# Altium schematic sheet KIT_ARDUINO_PER_R00.SchDoc: KIT ARDUINO 2022
size A4; Author: Valeria Bank; CompanyName: Sistemas De Representacion; Revision: R00; SheetNumber: 3; SheetTotal: 4; SPICEModelCacheQUHMHHDS: <root> / <DocumentId>QUHMHHDS</DocumentId> / <CacheFrame Number="0"> / <Model Name="res" Kind="MDL"> / <Text>*Default semiconductor resistor / .MODEL RES R()</Text> / </Model> / <Model Name="led0" Kind="MDL"> / <Text>*Typ INFRARED GaAs LED: Vf=1.2V Vr=5V If=40mA trr=3uS / *LED Pinout: 1=A, 2=K / .MODEL LED0 D (IS=93.5P RS=84M N=2.63 BV=5 IBV=10U / + CJO=2.97P VJ=.75 M=.333 TT=4.32U)</Text> / </Model> / <Model Name="npn" Kind="MDL"> / <Text>*Default NPN BJT / *NPN Trans Pinout: C,B,E / .MODEL NPN NPN()</Text> / </Model> / <Model Name="diode" Kind="MDL"> / <Text>*Default Diode / *Diode Pinout: A,K / .MODEL DIODE D()</Text> / </Model> / </CacheFrame> / </root>
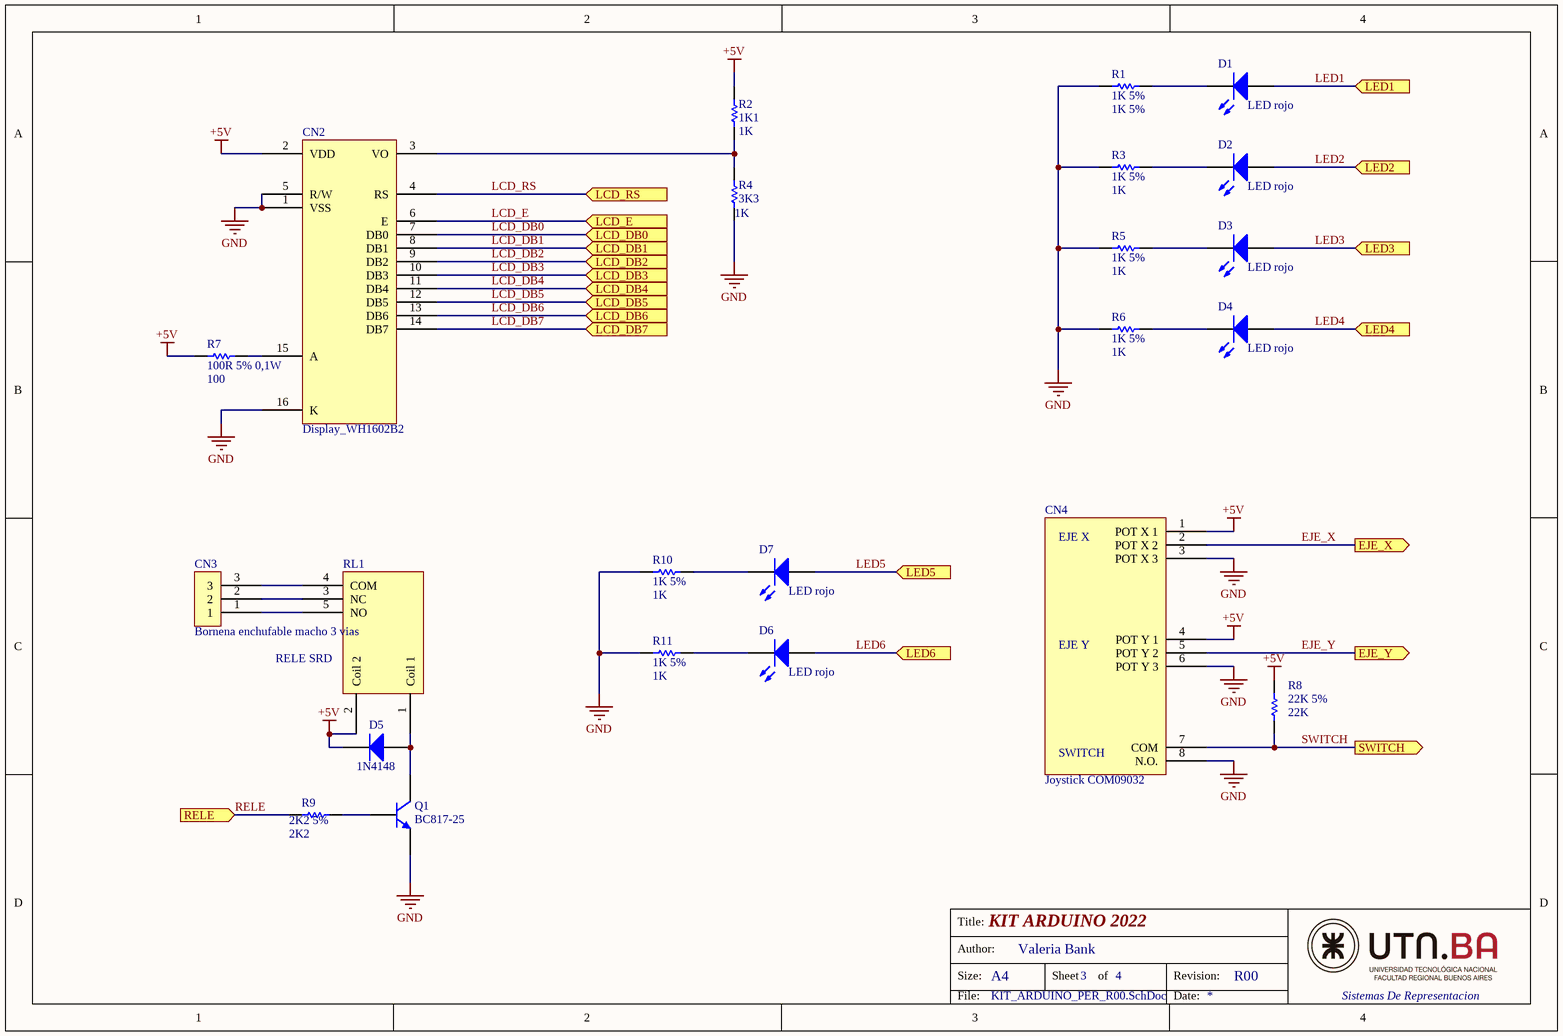
[diagram p0: KIT_ARDUINO_PER_R00.SchDoc]

## Parts
CN2  Display_WH1602B2  [WH1602B]
CN3  Bornena enchufable macho 3 vias  [BORNERA-3 VIAS]
CN4  Joystick COM09032  [Joystick 4398]
D1  LED rojo  [LED 5MM]
D2  LED rojo  [LED 5MM]
D3  LED rojo  [LED 5MM]
D4  LED rojo  [LED 5MM]
D5  1N4148  [SOD_323]
D6  LED rojo  [LED 5MM]
D7  LED rojo  [LED 5MM]
Q1  BC817-25  [SOT_23]
R1  1K 5%  [R_0805]
R2  1K1  value 1K  [R_0805]
R3  1K 5%  value 1K  [R_0805]
R4  3K3  value 1K  [R_0805]
R5  1K 5%  value 1K  [R_0805]
R6  1K 5%  value 1K  [R_0805]
R7  100R 5% 0,1W  value 100  [R_0805]
R8  22K 5%  value 22K  [R_0805]
R9  2K2 5%  value 2K2  [R_0805]
R10  1K 5%  value 1K  [R_0805]
R11  1K 5%  value 1K  [R_0805]
RL1  RELE SRD  [Relay]

## Ports
EJE_X (out), EJE_Y (out), LCD_DB0 (in), LCD_DB1 (in), LCD_DB2 (in), LCD_DB3 (in), LCD_DB4 (in), LCD_DB5 (in), LCD_DB6 (in), LCD_DB7 (in), LCD_E (in), LCD_RS (in), LED1 (in), LED2 (in), LED3 (in), LED4 (in), LED5 (in), LED6 (in), RELE (in), SWITCH (out)

## Nets
+5V: CN2.2(VDD) CN4.1(POT_X_1) CN4.4(POT_Y_1) D5.2(K) R2.2 R7.1 R8.2 RL1.2(Coil_2)
GND: CN2.1(VSS) CN2.5(R/W) CN2.16(K) CN4.3(POT_X_3) CN4.6(POT_Y_3) CN4.8(N.O.) Q1.3(E) R1.1 R3.1 R4.1 R5.1 R6.1 R10.1 R11.1
EJE_X: CN4.2(POT_X_2) ; port EJE_X
EJE_Y: CN4.5(POT_Y_2) ; port EJE_Y
LCD_DB0: CN2.7(DB0) ; port LCD_DB0
LCD_DB1: CN2.8(DB1) ; port LCD_DB1
LCD_DB2: CN2.9(DB2) ; port LCD_DB2
LCD_DB3: CN2.10(DB3) ; port LCD_DB3
LCD_DB4: CN2.11(DB4) ; port LCD_DB4
LCD_DB5: CN2.12(DB5) ; port LCD_DB5
LCD_DB6: CN2.13(DB6) ; port LCD_DB6
LCD_DB7: CN2.14(DB7) ; port LCD_DB7
LCD_E: CN2.6(E) ; port LCD_E
LCD_RS: CN2.4(RS) ; port LCD_RS
LED1: D1.1(A) ; port LED1
LED2: D2.1(A) ; port LED2
LED3: D3.1(A) ; port LED3
LED4: D4.1(A) ; port LED4
LED5: D7.1(A) ; port LED5
LED6: D6.1(A) ; port LED6
RELE: R9.1 ; port RELE
SWITCH: CN4.7(COM) R8.1 ; port SWITCH
NetCN2_3: CN2.3(VO) R2.1 R4.2
NetCN2_15: CN2.15(A) R7.2
NetCN3_1: CN3.1 RL1.5(NO)
NetCN3_2: CN3.2 RL1.3(NC)
NetCN3_3: CN3.3 RL1.4(COM)
NetD1_2: D1.2(K) R1.2
NetD2_2: D2.2(K) R3.2
NetD3_2: D3.2(K) R5.2
NetD4_2: D4.2(K) R6.2
NetD5_1: D5.1(A) Q1.1(C) RL1.1(Coil_1)
NetD6_2: D6.2(K) R11.2
NetD7_2: D7.2(K) R10.2
NetQ1_2: Q1.2(B) R9.2

## Notes on the sheet
- Title:
- Size:
- Author:
- A4
- Sheet
- of
- Revision:
- File:
- Date:
- (in symbol Joystick COM09032) EJE X; EJE Y; SWITCH

## Library data of the parts
CN3 = Header 3x
D1-D4 D6 D7 = LED0: Typical INFRARED GaAs LED; Published: 8-Jun-2000; LatestRevisionDate: 08-Jul-2005; LatestRevisionNote: Mech Layer 1 removed.; PackageReference: LED-0; Publisher: Altium Limited; PackageDescription: LED; 2 Leads
D5 = Diode: Default Diode; Published: 8-Jun-2000; LatestRevisionDate: 17-Jul-2002; LatestRevisionNote: Re-released for DXP Platform.; PackageVersion: Sep-1996; PackageReference: SMC; Publisher: Altium Limited; PackageDescription: DO-214-AB/SMC; 2 C-Bend Leads; Body 7.9 x 5.9 mm, inc. leads (LxW); Code_JEDEC: DO-214-AB
Q1 = NPN: NPN Bipolar Transistor; Published: 8-Jun-2000; LatestRevisionDate: 17-Jul-2002; LatestRevisionNote: Re-released for DXP Platform.; PackageReference: TO-226-AA; Publisher: Altium Limited; PackageDescription: TO, Flat Index; 3 In-Line, Axial Leads; Body Dia. 4.8mm; Leads 0.55 x 0.51 mm (max); Code_JEDEC: TO-226-AA
R1-R11 = Res Semi: Semiconductor Resistor; Published: 8-Jun-2000; LatestRevisionDate: 17-Jul-2002; LatestRevisionNote: Re-released for DXP Platform.; PackageReference: AXIAL-0.5; Publisher: Altium Limited; PackageDescription: Axial Device, Thru-Hole; 2 Leads; 0.5 in Pin Spacing
  R1: Value: 1K 5%